# Altium project Digital phase control_3phase.PrjPcb
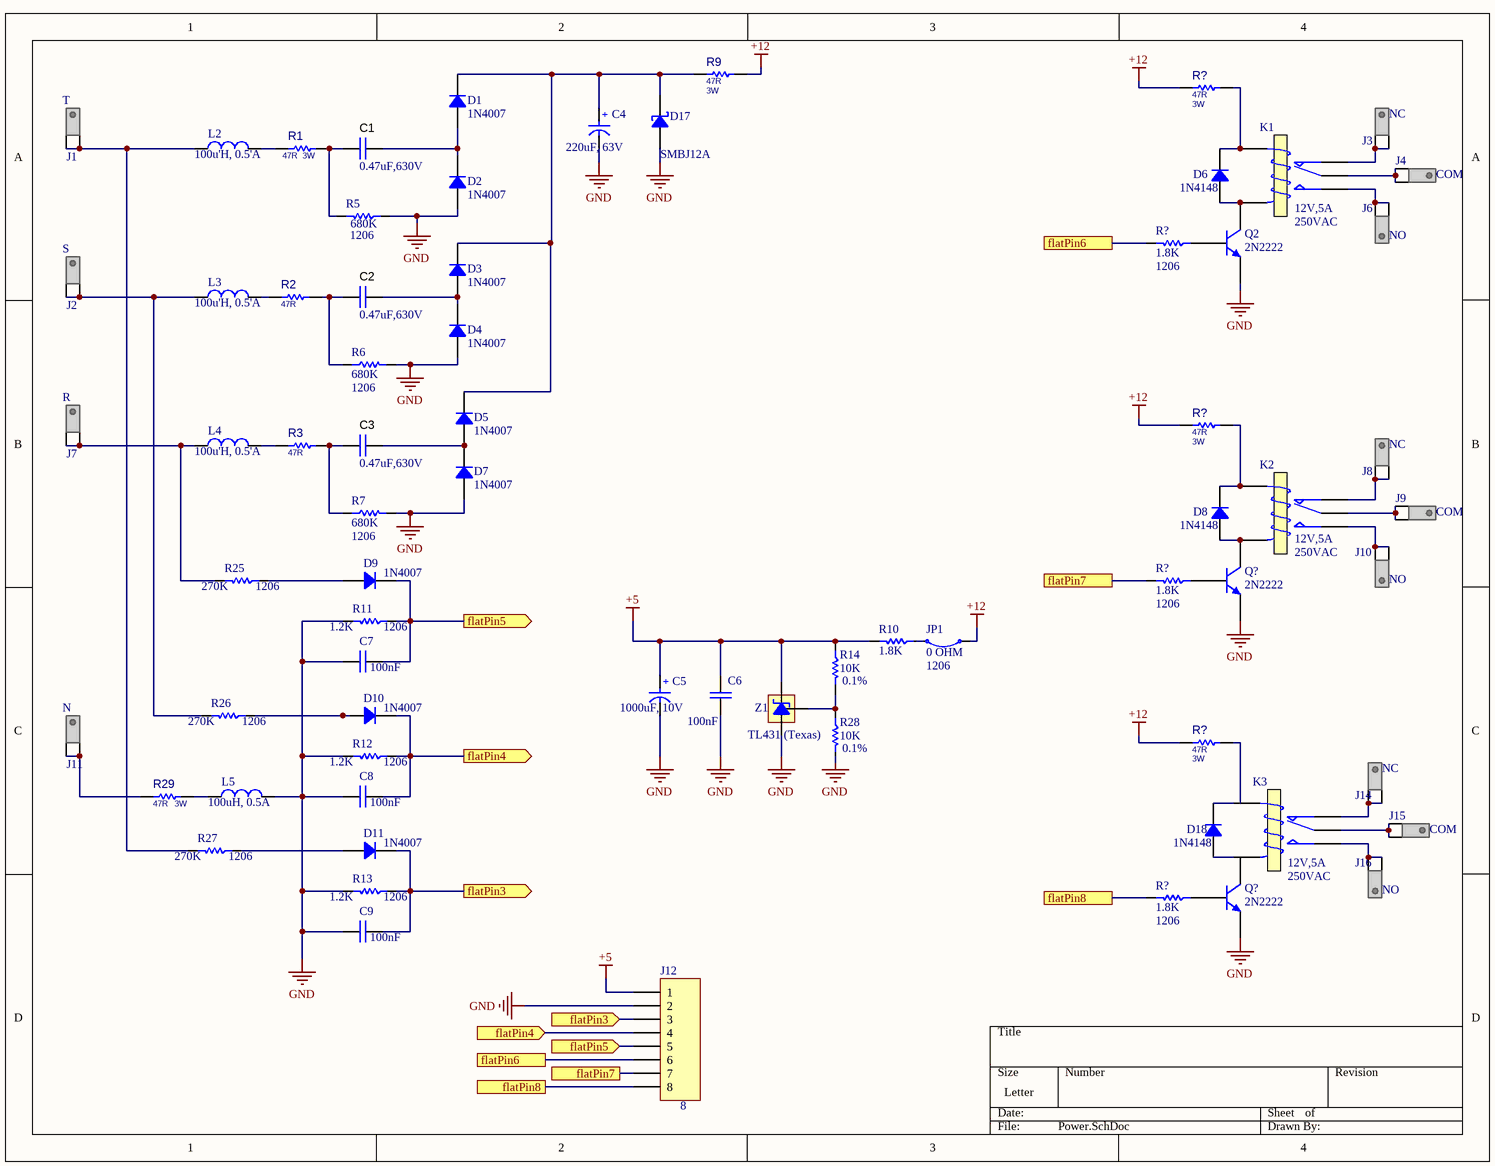
[diagram p0: Power.SchDoc]
2 sheets, 71 parts. Net scope: flat (ports and power ports of the same name join across sheets).
Board files: Power.PcbDoc, control_and_monitoring.PcbDoc
Sheets:
  Power.SchDoc
  control_and_monitoring.SchDoc

## Sheet Power.SchDoc: Digital 3 phase control
size Letter; Date: 11/19/2026; DrawnBy: Mohsen Zare; Revision: 1.0; SheetNumber: 1; SheetTotal: 2

### Parts
(Parts that share a designator on the sheet are numbered #1, #2 ... from top to bottom, then left to right.)
C1  0.47uF,630V  [Cap - 220n - 400V - Poly]
C2  0.47uF,630V  [Cap - 220n - 400V - Poly]
C3  0.47uF,630V  [Cap - 220n - 400V - Poly]
C4  220uF, 63V  [Cap electrolitic radial 10x16-5]
C5  1000uF, 10V  [Cap 04]
C6  100nF  [CAP 1206/3216]
C7  100nF  [CAP 1206/3216]
C8  100nF  [CAP 1206/3216]
C9  100nF  [CAP 1206/3216]
D1  1N4007  [DO214AC SMA]
D2  1N4007  [DO214AC SMA]
D3  1N4007  [DO214AC SMA]
D4  1N4007  [DO214AC SMA]
D5  1N4007  [DO214AC SMA]
D6  1N4148  [LL4148]
D7  1N4007  [DO214AC SMA]
D8  1N4148  [LL4148]
D9  1N4007  [DO214AC SMA]
D10  1N4007  [DO214AC SMA]
D11  1N4007  [DO214AC SMA]
D17  SMBJ12A  [DO214AA SMB]
D18  1N4148  [LL4148]
J1  PARAM: T  [TABTERM_2P8]  (hidden comment: TABTERM_2P8)
J2  PARAM: S  [TABTERM_2P8]  (hidden comment: TABTERM_2P8)
J3  NC  [TABTERM_2P8]
J4  COM  [TABTERM_2P8]
J6  NO  [TABTERM_2P8]
J7  PARAM: R  [TABTERM_2P8]  (hidden comment: TABTERM_2P8)
J8  NC  [TABTERM_2P8]
J9  COM  [TABTERM_2P8]
J10  NO  [TABTERM_2P8]
J11  PARAM: N  [TABTERM_2P8]  (hidden comment: TABTERM_2P8)
J12  8  [HDR_THT_8F_2.54mm]
J14  NC  [TABTERM_2P8]
J15  COM  [TABTERM_2P8]
J16  NO  [TABTERM_2P8]
JP1  Package: 1206  [RESC3216X60M (1206)]  (hidden comment: 0 OHM)
K1  Rating: 12V,5A  [Relay 18.85x15.35x15.70]  (hidden comment: 250VAC)
K2  Rating: 12V,5A  [Relay 18.85x15.35x15.70]  (hidden comment: 250VAC)
K3  Rating: 12V,5A  [Relay 18.85x15.35x15.70]  (hidden comment: 250VAC)
L2  100u'H, 0.5'A  [Res-(1/4)-Stand]
L3  100u'H, 0.5'A  [Res-(1/4)-Stand]
L4  100u'H, 0.5'A  [Res-(1/4)-Stand]
L5  100uH, 0.5A  [Res-(1/4)-Stand]
Q2  Inflow: 2N2222  [SOT23_M]  (hidden comment: NPN)
Q?#1  Inflow: 2N2222  [SOT23_M]  (hidden comment: NPN)
Q?#2  Inflow: 2N2222  [SOT23_M]  (hidden comment: NPN)
R1  PARAM: 3W  [R3W_AX09]  (hidden comment: 47R)
R2  47R  [R3W_AX09]
R3  47R  [R3W_AX09]
R5  Package: 1206  [RES 1206 (3216X08L)]  (hidden comment: 680K)
R6  Package: 1206  [RES 1206 (3216X08L)]  (hidden comment: 680K)
R7  Package: 1206  [RES 1206 (3216X08L)]  (hidden comment: 680K)
R9  PARAM: 3W  [R3W_AX09]  (hidden comment: 47R)
R10  1.8K  [RES 1206 (3216X08L)]
R11  Package: 1206  [RES 1206 (3216X08L)]  (hidden comment: 1.2K)
R12  Package: 1206  [RES 1206 (3216X08L)]  (hidden comment: 1.2K)
R13  Package: 1206  [RES 1206 (3216X08L)]  (hidden comment: 1.2K)
R14  Type: 0.1%  [RES 1206 (3216X08L)]  (hidden comment: 10K)
R25  Package: 1206  [RES 1206 (3216X08L)]  (hidden comment: 270K)
R26  Package: 1206  [RES 1206 (3216X08L)]  (hidden comment: 270K)
R27  Package: 1206  [RES 1206 (3216X08L)]  (hidden comment: 270K)
R28  Type: 0.1%  [RES 1206 (3216X08L)]  (hidden comment: 10K)
R29  PARAM: 3W  [R3W_AX09]  (hidden comment: 47R)
R?#1  PARAM: 3W  [R3W_AX09]  (hidden comment: 47R)
R?#2  Package: 1206  [RES 1206 (3216X08L)]  (hidden comment: 1.8K)
R?#3  PARAM: 3W  [R3W_AX09]  (hidden comment: 47R)
R?#4  Package: 1206  [RES 1206 (3216X08L)]  (hidden comment: 1.8K)
R?#5  PARAM: 3W  [R3W_AX09]  (hidden comment: 47R)
R?#6  Package: 1206  [RES 1206 (3216X08L)]  (hidden comment: 1.8K)
Z1  TL431 (Texas)  [sot23_BeC_M]

### Ports
flatPin3 (in, see Power[2D]), flatPin3 (out, see Power[2D]), flatPin4 (in, see Power[2C]), flatPin4 (out, see Power[2D]), flatPin5 (in, see Power[2C]), flatPin5 (out, see Power[2D]), flatPin6 (see Power[2D]), flatPin6 (see Power[3A]), flatPin7 (see Power[2D]), flatPin7 (see Power[3B]), flatPin8 (see Power[2D]), flatPin8 (see Power[3D])

### Nets
+5: C5.1(+) C6.1 J12.1 R10.2 R14.1 Z1.1(K)
+12: JP1.1 R9.1 R?#1.2 R?#3.2 R?#5.2
GND: C4.2(-) C5.2(-) C6.2 C7.1 C8.1 C9.1 D2.1 D4.1 D7.1 D17.1 J12.2 L5.2 Q2.2(E) Q?#1.2(E) Q?#2.2(E) R5.1 R6.2 R7.2 R11.2 R12.2 R13.2 R28.2 Z1.3(A)
NetC1_1: C1.1 R1.2 R5.2
NetC1_2: C1.2 D1.1 D2.2
NetC2_1: C2.1 R2.2 R6.1
NetC2_2: C2.2 D3.1 D4.2
NetC3_1: C3.1 R3.2 R7.1
NetC3_2: C3.2 D5.1 D7.2
NetC4_1: C4.1(+) D1.2 D3.2 D5.2 D17.2 R9.2
NetC7_2: C7.2 D9.2 J12.5 R11.1 ; port flatPin5
NetC8_2: C8.2 D10.2 J12.4 R12.1 ; port flatPin4
NetC9_2: C9.2 D11.2 J12.3 R13.1 ; port flatPin3
NetD6_1: D6.1 K1.5(T2) Q2.3(C)
NetD6_2: D6.2 K1.4(T1) R?#1.1
NetD8_1: D8.1 K2.5(T2) Q?#1.3(C)
NetD8_2: D8.2 K2.4(T1) R?#3.1
NetD9_1: D9.1 R25.1
NetD10_1: D10.1 R26.1
NetD11_1: D11.1 R27.1
NetD18_1: D18.1 K3.5(T2)
NetD18_2: D18.2 K3.4(T1)
NetJ1_1: J1.1 J1.2 L2.1 R27.2
NetJ2_1: J2.1 J2.2 L3.1 R26.2
NetJ3_1: J3.1 J3.2 K1.2(NC)
NetJ4_1: J4.1 J4.2 K1.1(COM)
NetJ6_1: J6.1 J6.2 K1.3(NO)
NetJ7_1: J7.1 J7.2 L4.1 R25.2
NetJ8_1: J8.1 J8.2 K2.2(NC)
NetJ9_1: J9.1 J9.2 K2.1(COM)
NetJ10_1: J10.1 J10.2 K2.3(NO)
NetJ11_1: J11.1 J11.2 R29.2
NetJ12_6: J12.6 R?#2.2 ; port flatPin6
NetJ12_7: J12.7 R?#4.2 ; port flatPin7
NetJ12_8: J12.8 R?#6.2 ; port flatPin8
NetJ14_1: J14.1 J14.2 K3.2(NC)
NetJ15_1: J15.1 J15.2 K3.1(COM)
NetJ16_1: J16.1 J16.2 K3.3(NO)
NetJP1_2: JP1.2 R10.1
NetL2_2: L2.2 R1.1
NetL3_2: L3.2 R2.1
NetL4_2: L4.2 R3.1
NetL5_1: L5.1 R29.1
NetQ2_1: Q2.1(B) R?#2.1
NetQ?#1_1: Q?#1.1(B) R?#4.1
NetQ?#2_1: Q?#2.1(B) R?#6.1
NetR14_2: R14.2 R28.1 Z1.2(REF)

Not connected (* = marked no-connect by the designer): Q?#2 3(C); R?#5 1

### Library data of the parts
C1-C3 = Cap_Polyester: Polyester Capacitor; Rating: Rating?; Type: Type?; Validation: NT; Inflow: inflow?; Value: 0.47uF,630V; Package: Package?
C4 = Cap_Elec_220u_50: Electrolit Capacitor; Inflow: 7217; Rating: Rating?; Type: Type?; Validation: NT; Value: 220uF, 63V; Package: Package?
C5 = Cap_Elec_1000u_16: Electrolit Capacitor; Inflow: 4222; Rating: Rating?; Type: Type?; Validation: NT; Value: 1000uF, 10V; Package: Package?
C6-C9 = Cap_Multi_SMD_100nF_1206: Bipolar ceramic capacitor SMD; Type: MultiLayer; Inflow: inflow?; Rating: 50V; Validation: Valid; Package: 1206; Value: 100nF
D1-D5 D7 D9-D11 = Semi_Diod_STD_1N4007_SMD: General purpose rectifiers; Rating: Rating?; Type: Type?; Validation: Valid; Inflow: 5247; Value: 1N4007; Package: Package?
D6 D8 D18 = Semi_Diod_STD_1N4148_MELF: High Conductance Fast Diode; Rating: Rating?; Type: Type?; Validation: NT; Inflow: 6205; Value: 1N4148; Package: MiniMELF
D17 = Semi_Diod_TVS_SMBJ15A: Transil diodes provide high overvoltage protection by clamping action; Rating: 15V; Type: TVS; Validation: Valid; Inflow: inflow?; Value: SMBJ12A; Package: SMB
J1-J4 J6-J11 J14-J16 = TABTERM_2P8: Tab terminal FASTON 110, 2.8 mm width, 0.8 mm thickness; MANF: MESA; MANF_P#: TE 2368; VALUE: TABTERM_2P8; MountType: THD; Part Type: Conn.
J12 = Con_FPH_8x1_V_THT_2.54: Header, single row, 8 pin; Inflow: 8101; Rating: Rating?; Validation: NT; Value: 8; Package: Package?; Type: Type?
JP1 = Other_Elec_Jumper_1206: Jumper Component; Inflow: inflow?; Validation: Valid; Type: Type?; Rating: Jumper; Value: 0 OHM
K1-K3 = SW_Relay_SPDT: SPDT Relay; Validation: Valid; Inflow: inflow?; Type: SPDT; Package: Dip; Value: 250VAC
L2-L5 = Ind_120u_Res_0.5: Inductor; Rating: Rating?; Type: Type?; Validation: NT; Inflow: 3328; Package: Package?
  L2-L4: Value: 100u'H, 0.5'A
  L5: Value: 100uH, 0.5A
Q2 Q?#1 Q?#2 = Semi_BJT_2N2222_SMD: NPN Switching Transistors; Rating: Rating?; Type: BJT; Validation: Valid; Value: NPN; Package: SOT-23
R1 R9 R29 R?#1 R?#3 R?#5 = RES_THD: RESISTOR, THD; MANF_P#: RK73H1ETTP4701F; MANF: KOA SPEER; DESC: DESCRIPTION; DIST#: MOUSER; PARAM2: 1%; ASSEMBLY: ASSEMBLY; PRICE: 100= 0.5$; VALUE: 47R
R2 R3 = RES_THD: RESISTOR, THD; MANF_P#: RK73H1ETTP4701F; MANF: KOA SPEER; PARAM: 3W; DESC: DESCRIPTION; DIST#: MOUSER; PARAM2: 1%; ASSEMBLY: ASSEMBLY; PRICE: 100= 0.5$; VALUE: 47R
R5-R7 R10-R14 R25-R28 R?#2 R?#4 R?#6 = Res_SMD_1206: Resistor; Inflow: inflow?; Rating: 0.25W; Validation: Valid
  R5-R7: Type: 10%; Value: 680K
  R10: Package: 1206; Type: 10%; Value: 1.8K
  R11-R13: Type: 10%; Value: 1.2K
  R14 R28: Package: 1206; Value: 10K
  R25-R27: Type: 10%; Value: 270K
  R?#2 R?#4 R?#6: Type: 10%; Value: 1.8K
Z1 = Semi_Diod_Zener_TL431_SMD: VREF, Programmable Precision ( Texas); Rating: Rating?; Validation: Valid; Inflow: inflow?; Value: TL431 (Texas); Package: Package?; Type: Type?

## Sheet control_and_monitoring.SchDoc
size A; SheetNumber: 1; SheetTotal: 1